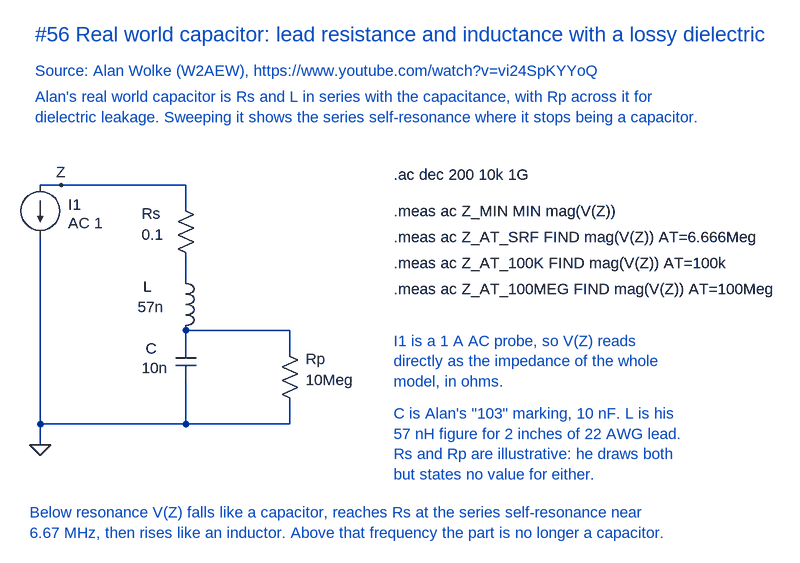
[diagram p0: schematic Real world capacitor.asc]
Real world capacitor.asc, the LTspice schematic file:
Version 4.1
SHEET 1 1600 1100
WIRE 288 0 256 0
WIRE 480 0 288 0
WIRE 480 32 480 0
WIRE 480 144 480 112
WIRE 640 224 480 224
WIRE 480 240 480 224
WIRE 640 256 640 224
WIRE 256 368 256 80
WIRE 480 368 480 304
WIRE 480 368 256 368
WIRE 640 368 640 336
WIRE 640 368 480 368
WIRE 256 400 256 368
FLAG 288 0 Z
FLAG 256 400 0
SYMBOL current 256 0 R0
WINDOW 0 43 30 Left 2
WINDOW 3 43 59 Left 2
SYMATTR InstName I1
SYMATTR Value AC 1
SYMBOL res 464 16 R0
WINDOW 0 -52 28 Left 2
WINDOW 3 -52 60 Left 2
SYMATTR InstName Rs
SYMATTR Value 0.1
SYMBOL ind 464 128 R0
WINDOW 0 -50 28 Left 2
WINDOW 3 -58 60 Left 2
SYMATTR InstName L
SYMATTR Value 57n
SYMBOL cap 464 240 R0
WINDOW 0 -46 12 Left 2
WINDOW 3 -52 42 Left 2
SYMATTR InstName C
SYMATTR Value 10n
SYMBOL res 624 240 R0
WINDOW 0 40 28 Left 2
WINDOW 3 40 60 Left 2
SYMATTR InstName Rp
SYMATTR Value 10Meg
TEXT 248 -232 Left 3 ;#56 Real world capacitor: lead resistance and inductance with a lossy dielectric
TEXT 248 -176 Left 2 ;Source: Alan Wolke (W2AEW), https://www.youtube.com/watch?v=vi24SpKYYoQ
TEXT 248 -136 Left 2 ;Alan's real world capacitor is Rs and L in series with the capacitance, with Rp across it for\ndielectric leakage. Sweeping it shows the series self-resonance where it stops being a capacitor.
TEXT 800 -16 Left 2 !.ac dec 200 10k 1G
TEXT 800 40 Left 2 !.meas ac Z_MIN MIN mag(V(Z))
TEXT 800 80 Left 2 !.meas ac Z_AT_SRF FIND mag(V(Z)) AT=6.666Meg
TEXT 800 120 Left 2 !.meas ac Z_AT_100K FIND mag(V(Z)) AT=100k
TEXT 800 160 Left 2 !.meas ac Z_AT_100MEG FIND mag(V(Z)) AT=100Meg
TEXT 800 240 Left 2 ;I1 is a 1 A AC probe, so V(Z) reads\ndirectly as the impedance of the whole\nmodel, in ohms.
TEXT 800 352 Left 2 ;C is Alan's "103" marking, 10 nF. L is his\n57 nH figure for 2 inches of 22 AWG lead.\nRs and Rp are illustrative: he draws both\nbut states no value for either.
TEXT 240 504 Left 2 ;Below resonance V(Z) falls like a capacitor, reaches Rs at the series self-resonance near\n6.67 MHz, then rises like an inductor. Above that frequency the part is no longer a capacitor.

The netlist it stands for:
* Real world capacitor.asc
I1 Z 0 AC 1
Rs Z N001 0.1
L N001 N002 57n
C N002 0 10n
Rp N002 0 10Meg
* #56 Real world capacitor: lead resistance and inductance with a lossy dielectric
* Source: Alan Wolke (W2AEW), https://www.youtube.com/watch?v=vi24SpKYYoQ
* Alan's real world capacitor is Rs and L in series with the capacitance, with Rp across it for
* dielectric leakage. Sweeping it shows the series self-resonance where it stops being a capacitor.
.ac dec 200 10k 1G
.meas ac Z_MIN MIN mag(V(Z))
.meas ac Z_AT_SRF FIND mag(V(Z)) AT=6.666Meg
.meas ac Z_AT_100K FIND mag(V(Z)) AT=100k
.meas ac Z_AT_100MEG FIND mag(V(Z)) AT=100Meg
* I1 is a 1 A AC probe, so V(Z) reads
* directly as the impedance of the whole
* model, in ohms.
* C is Alan's "103" marking, 10 nF. L is his
* 57 nH figure for 2 inches of 22 AWG lead.
* Rs and Rp are illustrative: he draws both
* but states no value for either.
* Below resonance V(Z) falls like a capacitor, reaches Rs at the series self-resonance near
* 6.67 MHz, then rises like an inductor. Above that frequency the part is no longer a capacitor.
.backanno
.end